# Altium schematic sheet 04-AMP.SchDoc: Amplifier
size A4; Organization: ORGANIZATION; Address1: ADDRESS 1; Address2: ADDRESS 2; Address3: ADDRESS 3; Address4: ADDRESS 4; SheetNumber: 4; SheetTotal: 7; ENG_APP_DATE: --/--/--; DSN_APP_DATE: --/--/--; CHK_APP_DATE: --/--/--
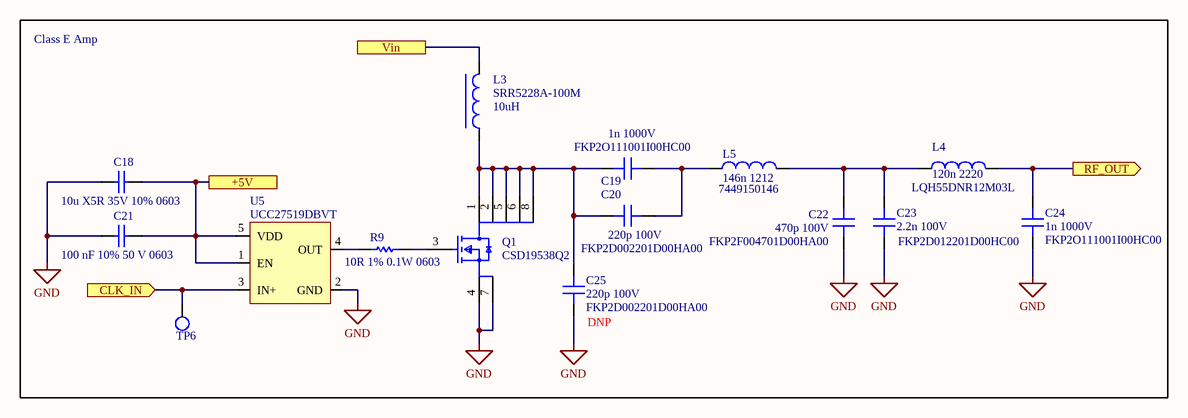
[diagram p0: 04-AMP.SchDoc]

## Parts
C18  10u X5R 35V 10% 0603  [C0603]
C19  FKP2O111001I00HC00  value 1n 1000V  [FKP2O111001I00HC00-Footprint-1]
C20  FKP2D002201D00HA00  value 220p 100V  [FKP2O111001I00HC00-Footprint-1]
C21  100 nF 10% 50 V 0603  [CAPC1608X90X40NL10T20]
C22  FKP2F004701D00HA00  value 470p 100V  [FKP2O111001I00HC00-Footprint-1]
C23  FKP2D012201D00HC00  value 2.2n 100V  [FKP2O111001I00HC00-Footprint-1]
C24  FKP2O111001I00HC00  value 1n 1000V  [FKP2O111001I00HC00-Footprint-1]
C25  FKP2D002201D00HA00  value 220p 100V  [FKP2O111001I00HC00-Footprint-1]
L3  SRR5228A-100M  value 10uH  [INDP5252X32N]
L4  LQH55DNR12M03L  value 120n 2220  [FP-LQH55DN_03-MFG]
L5  7449150146  value 146n 1212  [7449150146]
Q1  CSD19538Q2  [FP-DQK0006C-MFG]
R9  10R 1% 0.1W 0603  [R0603]
TP6  Touchpoint  [Touchpoint-Footprint-1]  (value not drawn)  (no BOM)
U5  UCC27519DBVT  [FP-DBV0005A-IPC_B]

## Ports
+5V, CLK_IN (in), RF_OUT (out), Vin

## Nets
GND: C18.2 C21.2 C22.1 C23.1 C24.2 C25.1 Q1.4(S) Q1.7(S) U5.2(GND)
+5V: C18.1 C21.1 U5.1(EN) U5.5(VDD) ; port +5V
CLK_IN: TP6.0 U5.3(IN+) ; port CLK_IN
RF_OUT: C24.1 L4.2 ; port RF_OUT
Vin: L3.2 ; port Vin
NetC19_1: C19.1 C20.2 L5.1
NetC19_2: C19.2 C20.1 C25.2 L3.1 Q1.1(D) Q1.2(D) Q1.5(D) Q1.6(D) Q1.8(D)
NetC22_2: C22.2 C23.2 L4.1 L5.2
NetQ1_3: Q1.3(G) R9.2
NetR9_1: R9.1 U5.4(OUT)

## Notes on the sheet
- Class E Amp
- (near C25) DNP
- Revision
- Project
- Author
- Page Title

## Library data of the parts
C18 = CMP-001-00153-3: MLCC 10u X5R 35V 10% 0603; MFR_Part_#: GRM188R6YA106MA73D; Manufacturer: Generic; Dielectric: X7R; Component Type: Standard; PartNumber: 10u X5R 35V 10% 0603; Value: 10u; LCSC_Part_#: C194427; Tolerance: 10%; Pin Count: 2; Status: Preferred; Source: GT_WH_Control.SCHLIB; Voltage: 35V; LCSC_Price_1ku: 0.0213; Design Item ID: 10u X5R 35V 10% 0603
C19 C24 = CMP-001-00223-1: Condensateurs à film FKP 2 1000 pF 1000 VDC 6.5x8x7.2 PCM 5; MFR_Part_#: FKP2O111001I00HC00
C20 C25 = CMP-001-00224-1: Condensateurs à film 220 pF 100 VDC 2.5%; MFR_Part_#: FKP2O111001I00HC00
C21 = CMP-001-00017-8: Chip Capacitor, 100 nF, +/- 10%, 50 V, 0603 (1608 Metric); MFR_Part_#: CC0603KRX7R9BB104; Voltage Rating: 50V; Value: 100nF; Capacitor Type: Ceramic; Mounting Technology: SM; LCSC_Price_1ku: 0.0015; Pins: 2; RoHS Compliant: True; LCSC_Part_#: C14663; Max Operating Temperature: 125°C; Tolerance: 10%; Case/Package: 0603; Min Operating Temperature: -55°C
C22 = CMP-001-00225-1: Condensateurs à film 470 pF 250 VDC 2.5%; MFR_Part_#: FKP2F004701D00HA00
C23 = CMP-001-00226-1: Condensateurs à film 2200pF 100 Volt 2.5%; MFR_Part_#: FKP2D012201D00HC00
L3 = CMP-006-00050-1: Inductances de puissance - CMS Ind,5.2x5.2x2.8,10uH+/-20%,2.3A,shd; MFR: Bourns; MFR_Part_#: SRR5228A-100M
L4 = CMP-006-00052-1: Inductor Power Chip Unshielded Wirewound 120nH 20% 1MHz Ferrite 6A 9.8mOhm DCR 2220 T/R; MFR: Murata; LCSC_Part_#: C711154; MFR_Part_#: LQH55DNR12M03L; LCSC_Price_1ku: 0.2902
L5 = CMP-006-00051-1: Inductor, 146Nh, 332Mhz, 19A, 20% Rohs Compliant: Yes; MFR: Wurth Elektronik; MFR_Part_#: 7449150146
Q1 = CMP-013-00050-1: 100-V, N channel NexFET™ power MOSFET, single SON 2 mm x 2 mm, 59 mOhm 6-WSON -55 to 150; LCSC_Part_#: C2838636; LCSC_Price_1ku: 0.3656; MFR_Part_#: CSD19538Q2
R9 = CMP-009-00307-3: Standard Resistor 10R 1% 0.1W 0603; MFR_Part_#: 0603WAF100JT5E; Manufacturer: Generic; TC: 200; Tolerance: 1%; LCSC_Price_1ku: 0.0007; Power: 0.1W; LCSC_Part_#: C22859; Source: GT_WH_Control.SCHLIB; Pin Count: 2; Component Type: Standard; Design Item ID: 100R 1% 0.1W 0603; Value: 10R; PartNumber: 10R 1% 0.1W 0603
TP6 = CMP-001-0002-2: 60mils touchpoint
U5 = CMP-015-00016-1: 4-A/4-A single-channel gate driver with 5-V UVLO, enable, and CMOS input 5-SOT-23 -40 to 140; MFR: Texas Instruments; MFR_Part_#: UCC27519DBVT; LCSC_Part_#: C2676969; LCSC_Price_1ku: 0.5183